# Altium project PGS-System.PrjPcb (part 12 of 16)

## Sheet ETH_SWITCH_INTERFACE.SchDoc
size 420 x 297 mm; SheetNumber: 20; SheetTotal: 27
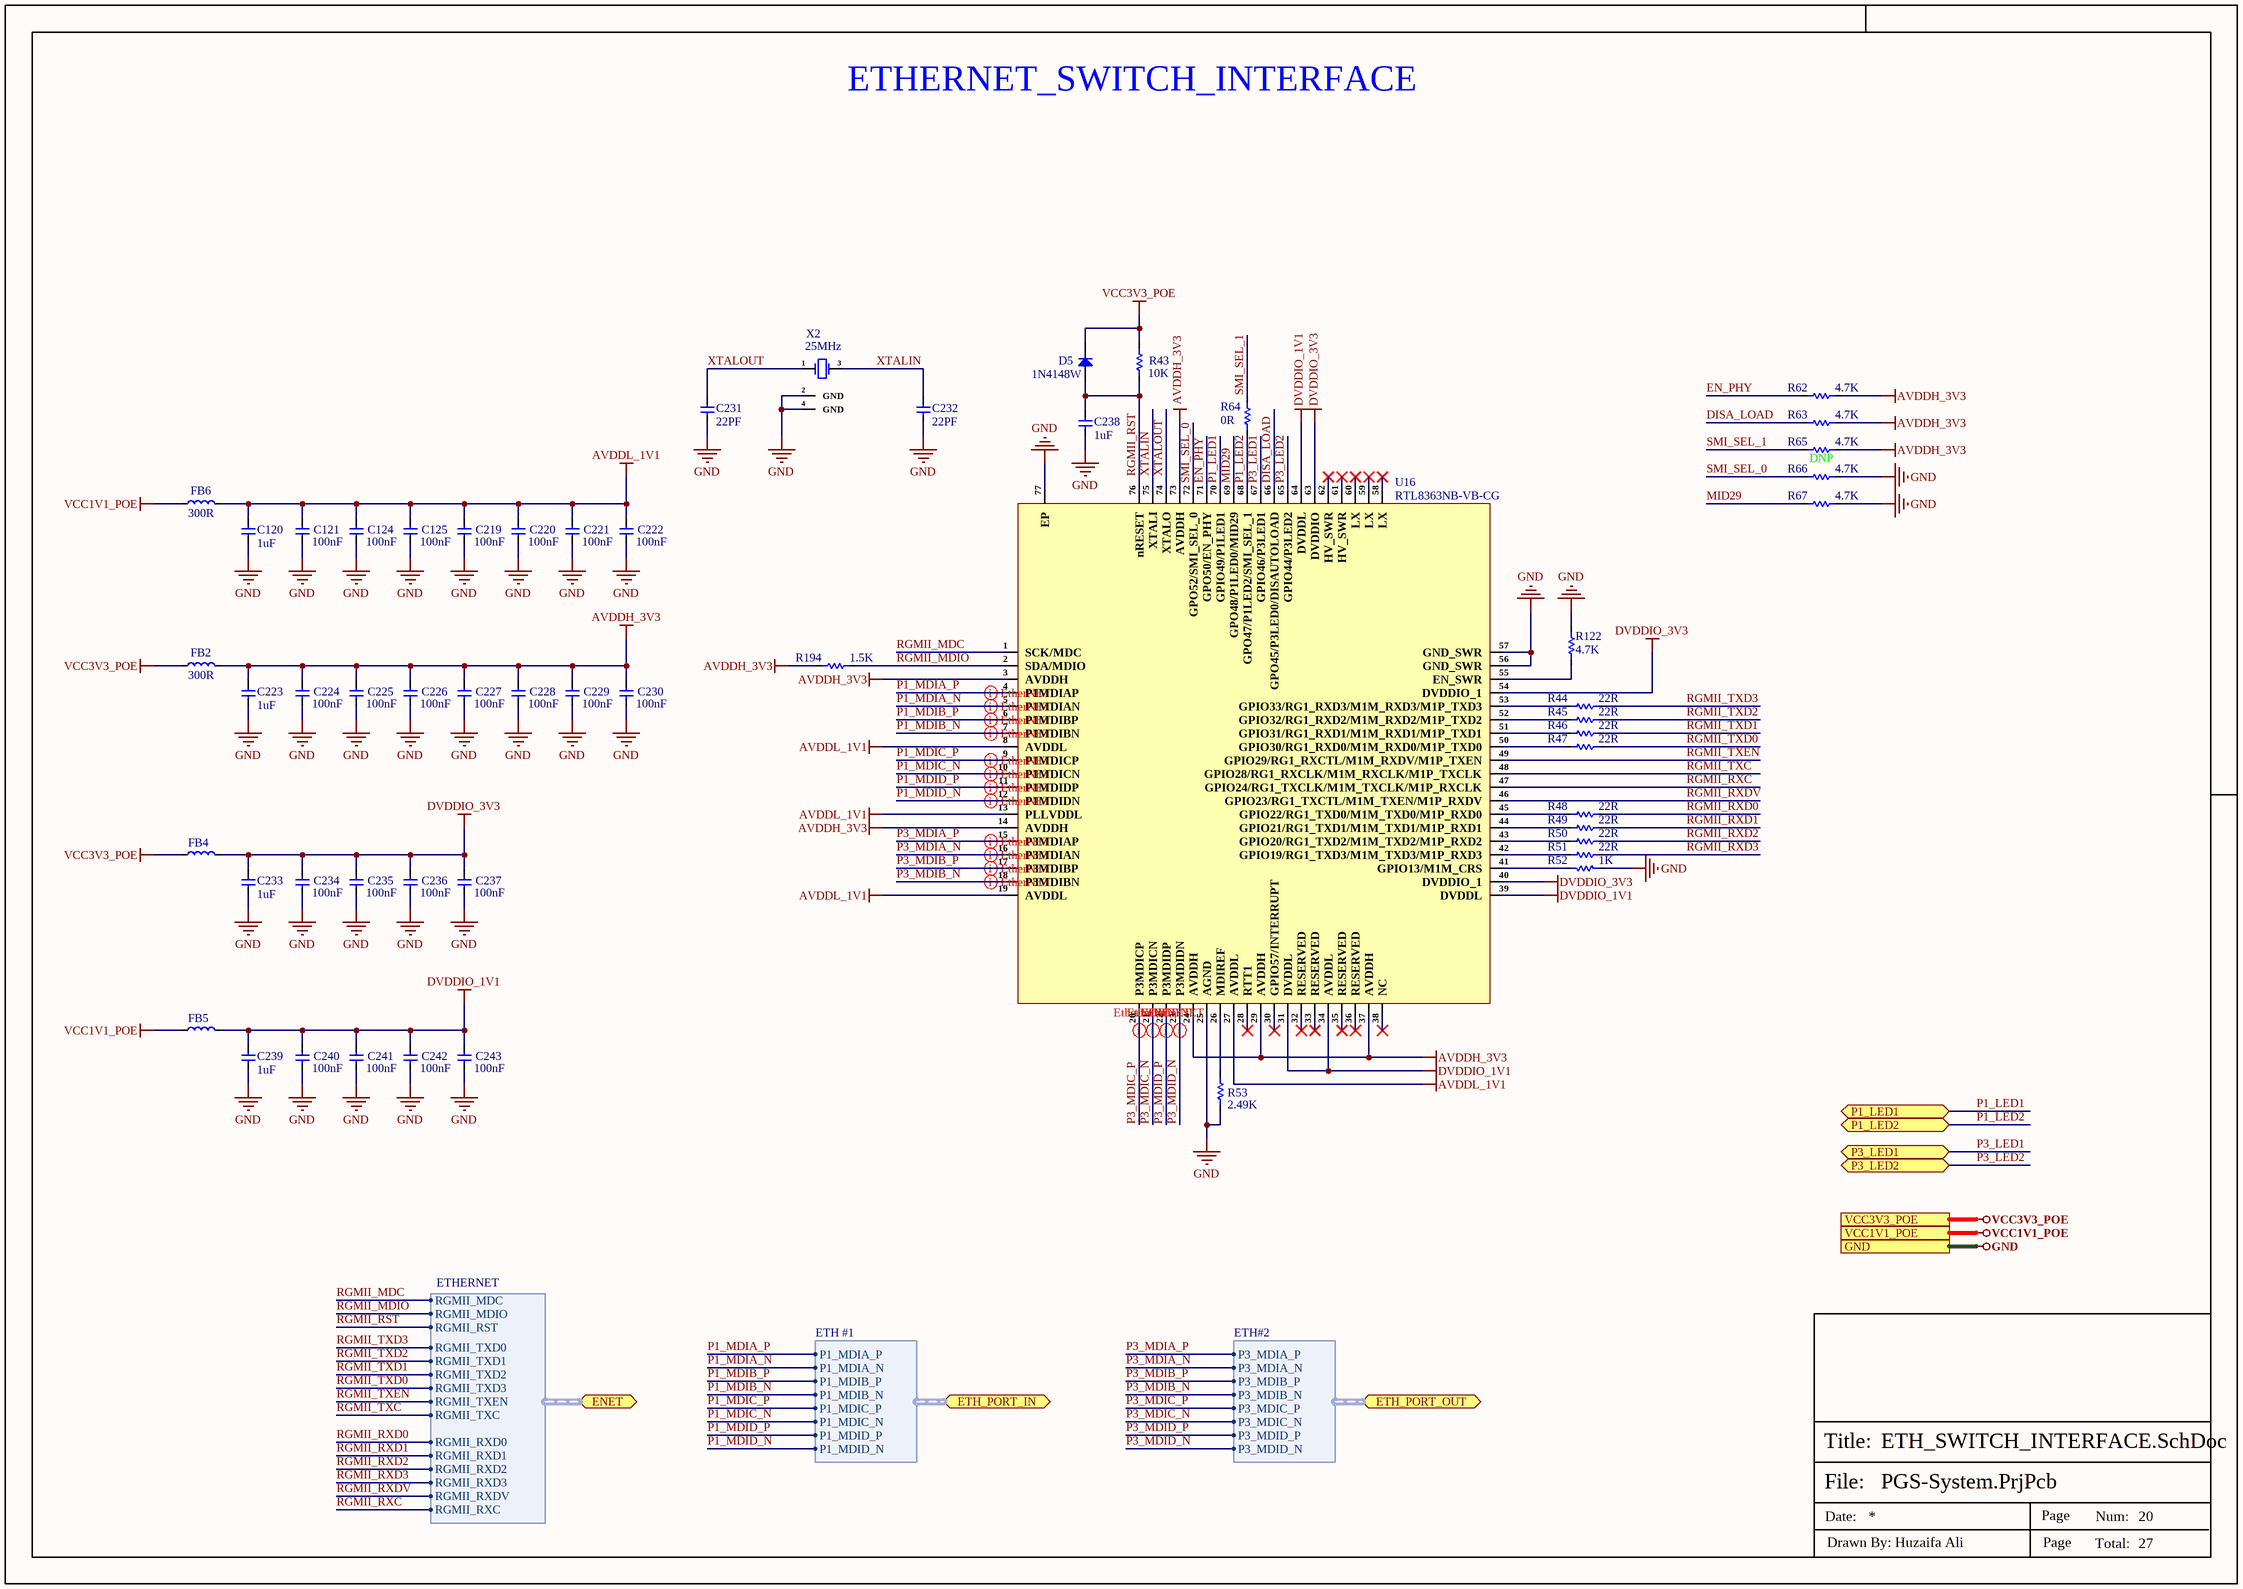
[diagram p20: ETH_SWITCH_INTERFACE.SchDoc]

### Parts
C120  1uF  [Cap-0402]
C121  100nF  [Cap-0402]
C124  100nF  [Cap-0402]
C125  100nF  [Cap-0402]
C219  100nF  [Cap-0402]
C220  100nF  [Cap-0402]
C221  100nF  [Cap-0402]
C222  100nF  [Cap-0402]
C223  1uF  [Cap-0402]
C224  100nF  [Cap-0402]
C225  100nF  [Cap-0402]
C226  100nF  [Cap-0402]
C227  100nF  [Cap-0402]
C228  100nF  [Cap-0402]
C229  100nF  [Cap-0402]
C230  100nF  [Cap-0402]
C231  22PF  [Cap-0402]
C232  22PF  [Cap-0402]
C233  1uF  [Cap-0402]
C234  100nF  [Cap-0402]
C235  100nF  [Cap-0402]
C236  100nF  [Cap-0402]
C237  100nF  [Cap-0402]
C238  1uF  [Cap-0402]
C239  1uF  [Cap-0402]
C240  100nF  [Cap-0402]
C241  100nF  [Cap-0402]
C242  100nF  [Cap-0402]
C243  100nF  [Cap-0402]
D5  1N4148W  [SOD-123]
FB2  300R  [IND-0603 (1608 Metric)]
FB4  742792641  [IND-0603 (1608 Metric)]  (value not drawn)
FB5  742792641  [IND-0603 (1608 Metric)]  (value not drawn)
FB6  300R  [IND-0603 (1608 Metric)]
R43  10K  [Res-0402]
R44  22R  [Res-0402]
R45  22R  [Res-0402]
R46  22R  [Res-0402]
R47  22R  [Res-0402]
R48  22R  [Res-0402]
R49  22R  [Res-0402]
R50  22R  [Res-0402]
R51  22R  [Res-0402]
R52  1K  [Res-0402]
R53  2.49K  [Res-0402]
R62  4.7K  [Res-0402]
R63  4.7K  [Res-0402]
R64  0R  [Res-0402]
R65  DNP  [Res-0402]
R66  4.7K  [Res-0402]
R67  4.7K  [Res-0402]
R122  4.7K  [Res-0402]
R194  1.5K  [Res-0402]
U16  RTL8363NB-VB-CG  [QFN-76]
X2  25MHz  [Q22FA12800090]

### Ports
ENET (bidir, harness ETHERNET, see RV1126_ETHERNET_SHEET[1D]), ETH_PORT_IN (bidir, harness ETH #1, see ETH_PoE-PD_INTERFACE[5D]), ETH_PORT_OUT (bidir, harness ETH#2, see PoE_PSE_CONTROLLER[4D]), GND (see BUCK_CONTROLLER_SHEET[3D], DDR3_SDRAM_SHEET[5D], DEBUG_UART_INTERFACE[3D], DIGITAL_MEMS_INTERFACE[3C], eMMC_INTERFACE[3D], ETH_PoE-PD_INTERFACE[4D], IR-CUT_LIGHT SENSOR_SHEET[3D], MIPI TO HDMI_MODULE[3D], MIPI-CSI_RXX_INTERFACE[3C], PoE_PSE_CONTROLLER[5D], POWER_LDO_SHEET[3D], POWER_PMIC_RK809_CODEC[3C], POWER_PMIC_RK809_DC DC[3D], POWER_PMIC_RK809_LDO[4C], POWER_PMIC_RK809_MGM[3D], RV1126_AUDIO_SHEET[3D], RV1126_DRAM_SHEET[4C], RV1126_eMMC_SPI-FLASH[3C], RV1126_ETHERNET_SHEET[3D], RV1126_OSC-PLL-PMUIO[3C], RV1126_POWER_SHEET[1D], RV1126_SARADC_SHEET[3C], RV1126_SDMMC_SHEET[3C], SPI_FLASH_INTERFACE[3D], USB2.0_DEBUG_UART[3D], WIFI_AP6256_SHEET[3C]), P1_LED1 (bidir, see ETH_PoE-PD_INTERFACE[3D]), P1_LED2 (bidir, see ETH_PoE-PD_INTERFACE[3D]), P3_LED1 (bidir, see PoE_PSE_CONTROLLER[5D]), P3_LED2 (bidir, see PoE_PSE_CONTROLLER[5D]), VCC1V1_POE (see POWER_LDO_SHEET[3D]), VCC3V3_POE (see PoE_PSE_CONTROLLER[5D], POWER_LDO_SHEET[3D])

### Harnesses
ETH #1: P1_MDIA_P, P1_MDIA_N, P1_MDIB_P, P1_MDIB_N, P1_MDIC_P, P1_MDIC_N, P1_MDID_P, P1_MDID_N
ETH#2: P3_MDIA_P, P3_MDIA_N, P3_MDIB_P, P3_MDIB_N, P3_MDIC_P, P3_MDIC_N, P3_MDID_P, P3_MDID_N
ETHERNET: RGMII_MDC, RGMII_MDIO, RGMII_RST, RGMII_TXD3, RGMII_TXD2, RGMII_TXD1, RGMII_TXD0, RGMII_TXEN, RGMII_TXC, RGMII_RXC, RGMII_RXDV, RGMII_RXD0, RGMII_RXD1, RGMII_RXD2, RGMII_RXD3

### Nets
AVDDH_3V3: C223.2 C224.2 C225.2 C226.2 C227.2 C228.2 C229.2 C230.2 FB2.2 R62.1 R63.1 R65.1 R194.1 U16.3(AVDDH) U16.14(AVDDH) U16.24(AVDDH) U16.29(AVDDH) U16.37(AVDDH) U16.73(AVDDH)
AVDDL_1V1: C120.2 C121.2 C124.2 C125.2 C219.2 C220.2 C221.2 C222.2 FB6.2 U16.8(AVDDL) U16.13(PLLVDDL) U16.19(AVDDL) U16.27(AVDDL)
DVDDIO_1V1: C239.2 C240.2 C241.2 C242.2 C243.2 FB5.2 U16.31(DVDDL) U16.34(AVDDL) U16.39(DVDDL) U16.64(DVDDL)
DVDDIO_3V3: C233.2 C234.2 C235.2 C236.2 C237.2 FB4.2 U16.40(DVDDIO_1) U16.54(DVDDIO_1) U16.63(DVDDIO)
GND: C120.1 C121.1 C124.1 C125.1 C219.1 C220.1 C221.1 C222.1 C223.1 C224.1 C225.1 C226.1 C227.1 C228.1 C229.1 C230.1 C231.1 C232.1 C233.1 C234.1 C235.1 C236.1 C237.1 C238.1 C239.1 C240.1 C241.1 C242.1 C243.1 R52.1 R53.1 R66.1 R67.1 R122.2 U16.25(AGND) U16.56(GND_SWR) U16.57(GND_SWR) U16.77(EP) X2.2(GND) X2.4(GND) ; port GND  [project net KSENSD]
VCC1V1_POE: FB5.1 FB6.1 ; port VCC1V1_POE
VCC3V3_POE: D5.2(K) FB2.1 FB4.1 R43.1 ; port VCC3V3_POE
DISA_LOAD: R63.2 U16.66(GPO45/P3LED0/DISAUTOLOAD)
EN_PHY: R62.2 U16.71(GPO50/EN_PHY)
MID29: R67.2 U16.69(GPO48/P1LED0/MID29)
P1_LED1: U16.70(GPIO49/P1LED1) ; port P1_LED1
P1_LED2: R64.1 U16.68(GPO47/P1LED2/SMI_SEL_1) ; port P1_LED2
P1_MDIA_N: U16.5(P1MDIAN) ; port ETH_PORT_IN.P1_MDIA_N
P1_MDIA_P: U16.4(P1MDIAP) ; port ETH_PORT_IN.P1_MDIA_P
P1_MDIB_N: U16.7(P1MDIBN) ; port ETH_PORT_IN.P1_MDIB_N
P1_MDIB_P: U16.6(P1MDIBP) ; port ETH_PORT_IN.P1_MDIB_P
P1_MDIC_N: U16.10(P1MDICN) ; port ETH_PORT_IN.P1_MDIC_N
P1_MDIC_P: U16.9(P1MDICP) ; port ETH_PORT_IN.P1_MDIC_P
P1_MDID_N: U16.12(P1MDIDN) ; port ETH_PORT_IN.P1_MDID_N
P1_MDID_P: U16.11(P1MDIDP) ; port ETH_PORT_IN.P1_MDID_P
P3_LED1: U16.67(GPIO46/P3LED1) ; port P3_LED1
P3_LED2: U16.65(GPIO44/P3LED2) ; port P3_LED2
P3_MDIA_N: U16.16(P3MDIAN) ; port ETH_PORT_OUT.P3_MDIA_N
P3_MDIA_P: U16.15(P3MDIAP) ; port ETH_PORT_OUT.P3_MDIA_P
P3_MDIB_N: U16.18(P3MDIBN) ; port ETH_PORT_OUT.P3_MDIB_N
P3_MDIB_P: U16.17(P3MDIBP) ; port ETH_PORT_OUT.P3_MDIB_P
P3_MDIC_N: U16.21(P3MDICN) ; port ETH_PORT_OUT.P3_MDIC_N
P3_MDIC_P: U16.20(P3MDICP) ; port ETH_PORT_OUT.P3_MDIC_P
P3_MDID_N: U16.23(P3MDIDN) ; port ETH_PORT_OUT.P3_MDID_N
P3_MDID_P: U16.22(P3MDIDP) ; port ETH_PORT_OUT.P3_MDID_P
RGMII_MDC: U16.1(SCK/MDC) ; port ENET.RGMII_MDC
RGMII_MDIO: R194.2 U16.2(SDA/MDIO) ; port ENET.RGMII_MDIO
RGMII_RST: C238.2 D5.1(A) R43.2 U16.76(nRESET) ; port ENET.RGMII_RST
RGMII_RXC: U16.47(GPIO24/RG1_TXCLK/M1M_TXCLK/M1P_RXCLK) ; port ENET.RGMII_RXC
RGMII_RXD0: R48.2 ; port ENET.RGMII_RXD0
RGMII_RXD1: R49.2 ; port ENET.RGMII_RXD1
RGMII_RXD2: R50.2 ; port ENET.RGMII_RXD2
RGMII_RXD3: R51.2 ; port ENET.RGMII_RXD3
RGMII_RXDV: U16.46(GPIO23/RG1_TXCTL/M1M_TXEN/M1P_RXDV) ; port ENET.RGMII_RXDV
RGMII_TXC: U16.48(GPIO28/RG1_RXCLK/M1M_RXCLK/M1P_TXCLK) ; port ENET.RGMII_TXC
RGMII_TXD0: R47.2 ; port ENET.RGMII_TXD3
RGMII_TXD1: R46.2 ; port ENET.RGMII_TXD2
RGMII_TXD2: R45.2 ; port ENET.RGMII_TXD1
RGMII_TXD3: R44.2 ; port ENET.RGMII_TXD0
RGMII_TXEN: U16.49(GPIO29/RG1_RXCTL/M1M_RXDV/M1P_TXEN) ; port ENET.RGMII_TXEN
SMI_SEL_0: R66.2 U16.72(GPO52/SMI_SEL_0)
SMI_SEL_1: R64.2 R65.2
XTALIN: C232.2 U16.75(XTALI) X2.3(OSC2)
XTALOUT: C231.2 U16.74(XTALO) X2.1(OSC1)
NetR44_1: R44.1 U16.53(GPIO33/RG1_RXD3/M1M_RXD3/M1P_TXD3)
NetR45_1: R45.1 U16.52(GPIO32/RG1_RXD2/M1M_RXD2/M1P_TXD2)
NetR46_1: R46.1 U16.51(GPIO31/RG1_RXD1/M1M_RXD1/M1P_TXD1)
NetR47_1: R47.1 U16.50(GPIO30/RG1_RXD0/M1M_RXD0/M1P_TXD0)
NetR48_1: R48.1 U16.45(GPIO22/RG1_TXD0/M1M_TXD0/M1P_RXD0)
NetR49_1: R49.1 U16.44(GPIO21/RG1_TXD1/M1M_TXD1/M1P_RXD1)
NetR50_1: R50.1 U16.43(GPIO20/RG1_TXD2/M1M_TXD2/M1P_RXD2)
NetR51_1: R51.1 U16.42(GPIO19/RG1_TXD3/M1M_TXD3/M1P_RXD3)
NetR52_2: R52.2 U16.41(GPIO13/M1M_CRS)
NetR53_2: R53.2 U16.26(MDIREF)
NetR122_1: R122.1 U16.55(EN_SWR)

Not connected (* = marked no-connect by the designer): U16 28(RTT1)* 30(GPIO57/INTERRUPT)* 32(RESERVED)* 33(RESERVED)* 35(RESERVED)* 36(RESERVED)* 38(NC)* 58(LX)* 59(LX)* 60(LX)* 61(HV_SWR)* 62(HV_SWR)*

### Layout directives
differential pair; differential pair class Ethernet_Lines; net class Ethernet; rule Matched Net Lengths [Tolerance = 20mil]; rule Impedance Constraint [Min = 97.00    Max = 105.0    ]: P1_MDIA_N, P1_MDIA_P, P1_MDIB_N, P1_MDIB_P, P1_MDIC_N, P1_MDIC_P, P1_MDID_N, P1_MDID_P, P3_MDIA_N, P3_MDIA_P, P3_MDIB_N, P3_MDIB_P, P3_MDIC_N, P3_MDIC_P, P3_MDID_N, P3_MDID_P

### Notes on the sheet
- ETHERNET_SWITCH_INTERFACE
- (near R43) AVDDH_3V3
- (near R64) DVDDIO_1V1
- DVDDIO_3V3
- (near R65) 4.7K
- File:
- Title:
- Date:
- Page
- Num:
- Total:
- Drawn By: Huzaifa Ali

### Library data of the parts
C120 C223 C233 C238 C239 = CC0402KRX5R7BB105: CAP CER 1UF 16V X5R 0402; Manufacturer: Yageo; Tolerance: 10%; Item Type: Capacitor; Supplier 1: Digi-Key; Manufacturer Part Number: CC0402KRX5R7BB105; Stock 1: 1405667; Pricing 1: 1=0.36, 10=0.252, 100=0.1512, 500=0.1134, 1000=0.09576, 2500=0.09072, 5000=0.08568 (USD); Mount: Surface Mount; Case/Package: 0402; Weight: 2.3E-05oz; Case Code (Imperial): 0402; Case Code (Metric): 1005; Min Operating Temperature: -55°C; Max Operating Temperature: 85°C; Capacitance: 1uF; Dielectric: X5R; Packaging: Tape and Reel; Voltage Rating (DC): 16V; Voltage Rating: 16V; Termination: SMD/SMT; Composition: Ceramic; Length: 1mm; Height: 0.5mm; Width: 0.02inch; Thickness: 0.022inch; Depth: 0.5mm; Radiation Hardening: No; Lead Free: Lead Free; Halogen Free: Halogen Free; ComponentLink1URL: http://www.yageo.com/documents/recent/UPY-GPHC_X5R_4V-to-50V_12.pdf?src-supplier=Avnet+Europe; ComponentLink1Description: http://www.yageo.com/documents/recent/UPY-GPHC_X5R_4V-to-50V_12.pdf?src-supplier=Avnet+Europe; Supplier Part Number 1: 311-1691-6-ND; LCSC Part Number: C325464
C121 C124 C125 C219-C222 C224-C230 C234-C237 C240-C243 = CC0402KRX5R7BB104: CAP CER 0.1UF 16V X5R 0402; Manufacturer: Yageo; Tolerance: 10%; Supplier 1: Mouser; Manufacturer Part Number: CC0402KRX5R7BB104; RoHS: Yes; Category: Ceramic Capacitors; Stock 1: 936792; Pricing 1: 1=0.10000, 10=0.02300, 50=0.02300, 100=0.01100, 1000=0.00600, 10000=0.00400 (USD); Mount: Surface Mount; Case/Package: 0402; Case Code (Imperial): 0402; Case Code (Metric): 1005; Min Operating Temperature: -55°C; Max Operating Temperature: 85°C; Capacitance: 100nF; Packaging: Tape and Reel; Voltage Rating: 16V; Dielectric: X5R; Termination: SMD/SMT; Voltage Rating (DC): 16V; Package Quantity: 1; Length: 1mm; Width: 0.02inch; Thickness: 0.022inch; Lead Free: Lead Free; Halogen Free: Halogen Free; ComponentLink1URL: https://datasheet.ciiva.com/155/mlccorderingcode-155879.pdf?src-supplier=Digi-Key; ComponentLink1Description: https://datasheet.ciiva.com/155/mlccorderingcode-155879.pdf?src-supplier=Digi-Key; ComponentLink2URL: https://datasheet.ciiva.com/155/mlccorderingcode-155878.pdf?src-supplier=Digi-Key; ComponentLink2Description: https://datasheet.ciiva.com/155/mlccorderingcode-155878.pdf?src-supplier=Digi-Key; ComponentLink3URL: https://datasheet.ciiva.com/155/mlccorderingcode-155880.pdf?src-supplier=Digi-Key; ComponentLink3Description: https://datasheet.ciiva.com/155/mlccorderingcode-155880.pdf?src-supplier=Digi-Key; Supplier Part Number 1: 603-CC402KRX5R7BB104; LCSC Part Number: C106204; Number of Pins: 2; Resistor Type: Ceramic; Series: CC; Construction: Flat; Height: 0.5mm; Depth: 0.5mm; Radiation Hardening: No; REACH SVHC: Unknown; RoHS Compliant: Yes; ComponentLink4URL: https://datasheet.ciiva.com/11464/upy-gphc-x5r-4v-to-50v-12-11464869.pdf?src-supplier=Avnet; ComponentLink4Description: https://datasheet.ciiva.com/11464/upy-gphc-x5r-4v-to-50v-12-11464869.pdf?src-supplier=Avnet
C231 C232 = CC0402JRNPO9BN220: CAP CER 22PF 50V C0G/NPO 0402; Manufacturer: Yageo; Dielectric Material: Ceramic; Tolerance: 5%; Dielectric: C0G; Temperature Coefficient: 30ppm/°C; Insulation Resistance: 100GR; Item Type: Capacitor; Supplier 1: Future Electronics; Manufacturer Part Number: CC0402JRNPO9BN220; RoHS: Yes; Category: Ceramic Capacitors; Stock 1: 200000; Pricing 1: 10000=0.00220, 40000=0.00210, 150000=0.00200, 400000=0.00190, 1000000=0.00180 (USD); Mounting Technology: Surface Mount; Case/Package: 0402; Pins: 2; Case Code (Metric): 1005; Case Code (Imperial): 0402; Min Operating Temperature: -55°C; Max Operating Temperature: 125°C; Value: 22pF; Voltage Rating: 50V; Packaging: Tape and Reel; Package Quantity: 1; Voltage Rating (DC): 50V; Termination: SMD/SMT; Resistor Type: Ceramic; Voltage: 50V; Series: CC; Length: 1mm; Width: 0.02inch; Height: 0.5mm; Thickness: 0.022inch; Depth: 0.5mm; Radiation Hardening: No; Reach SVHC Compliant: Yes; Lead Free: Lead Free; RoHS Compliant: Yes; ComponentLink1URL: https://datasheet.ciiva.com/5789/1443161-5789509.pdf?src-supplier=Farnell; ComponentLink1Description: https://datasheet.ciiva.com/5789/1443161-5789509.pdf?src-supplier=Farnell; ComponentLink2URL: https://datasheet.ciiva.com/8033/1443161-8033606.pdf?src-supplier=Element14; ComponentLink2Description: https://datasheet.ciiva.com/8033/1443161-8033606.pdf?src-supplier=Element14; ComponentLink3URL: https://datasheet.ciiva.com/7656/1132289-7656615.pdf?src-supplier=Element14; ComponentLink3Description: https://datasheet.ciiva.com/7656/1132289-7656615.pdf?src-supplier=Element14; ComponentLink4URL: https://datasheet.ciiva.com/8033/1443161-8033607.pdf?src-supplier=Element14; ComponentLink4Description: https://datasheet.ciiva.com/8033/1443161-8033607.pdf?src-supplier=Element14; ComponentLink5URL: https://datasheet.ciiva.com/8033/1443161-8033605.pdf?src-supplier=Element14; ComponentLink5Description: https://datasheet.ciiva.com/8033/1443161-8033605.pdf?src-supplier=Element14; ComponentLink6URL: https://datasheet.ciiva.com/143/mlccorderingcode-143987.pdf?src-supplier=Digi-Key; ComponentLink6Description: https://datasheet.ciiva.com/143/mlccorderingcode-143987.pdf?src-supplier=Digi-Key; ComponentLink7URL: https://datasheet.ciiva.com/143/mlccorderingcode-143986.pdf?src-supplier=Digi-Key; ComponentLink7Description: https://datasheet.ciiva.com/143/mlccorderingcode-143986.pdf?src-supplier=Digi-Key; ComponentLink8URL: https://datasheet.ciiva.com/143/mlccorderingcode-143988.pdf?src-supplier=Digi-Key; ComponentLink8Description: https://datasheet.ciiva.com/143/mlccorderingcode-143988.pdf?src-supplier=Digi-Key; ComponentLink9URL: https://datasheet.ciiva.com/5425/upy-gp-np0-16v-to-50v-8-5425483.pdf?src-supplier=Mouser; ComponentLink9Description: https://datasheet.ciiva.com/5425/upy-gp-np0-16v-to-50v-8-5425483.pdf?src-supplier=Mouser; ComponentLink10URL: https://datasheet.ciiva.com/15189/getdatasheetpartid-370074-15189117.pdf?src-supplier=Verical; ComponentLink10Description: https://datasheet.ciiva.com/15189/getdatasheetpartid-370074-15189117.pdf?src-supplier=Verical; Supplier Part Number 1: 9105957; LCSC Part Number: C106203
D5 = 1N4148W: 100V 400mW Single 1.25V@150mA 8ns 300mA SOD-123 Switching Diode ROHS; Manufacturer: JSMSEMI; ComponentLink1Description: LCSC; ComponentLink1URL: https://www.lcsc.com/product-detail/Switching-Diode_JSMSEMI-1N4148W_C917030.html; Manufacturer Part Number: 1N4148W; Package: SOD-123; LCSC Part Number: C917030; Item Type: Diode
FB2 FB6 = ACMS160808A3012A: 150mΩ ±25% 300Ω@100MHz 0603 Ferrite Beads ROHS; Manufacturer: HYHONGYEX; Manufacturer Part Number: ACMS160808A3012A; Package: 0603; LCSC Part Number: C963867; Item Type: Ferrite Bead; ComponentLink1Description: LCSC; ComponentLink1URL: https://www.lcsc.com/product-detail/span-style-background-color-ff0-Ferrite-span-Beads_HYHONGYEX-ACMS160808A3012A_C963867.html
FB4 FB5 = 742792641: FERRITE BEAD 300 OHM 0603 1LN; Manufacturer: Wurth Electronics; RMS Current (Irms): 2A; ESR: 150mR; Tolerance: 25%; Impedance: 300R; Number of Lines: 1; Test Frequency: 100MHz; Value: 18nH; Supplier: Digikey; LCSC Part Number: C2649308; Manufacturer Part Number: 742792641; RoHS: Yes; Item Type: Ferrite Bead; Stock: 95770; Pricing: 1=0.18, 50=0.179, 100=0.165, 500=0.158, 1000=0.15, 2000=0.143 (USD); Mounting Technology: Surface Mount; Case/Package: SMD/SMT; Weight: 0.000141oz; Core Material: Ferrite; Case Code (Metric): 1608; Case Code (Imperial): 0603; Material: Ferrite; Min Operating Temperature: -55°C; Max Operating Temperature: 125°C; Package Quantity: 1; Current Rating: 2A; Packaging: Tape and Reel; Max Current Rating: 2A; Max DC Current: 2A; Termination: SMD/SMT; Series: WE-CBF; Length: 1.6mm; Width: 0.8mm; Height: 0.8mm; Depth: 0.8mm; Lead Free: Lead Free; Reach SVHC Compliant: Unknown; RoHS Compliant: Yes; ComponentLink1URL: https://datasheet.ciiva.com/1466/1705830-1466501.pdf?src-supplier=Element14; ComponentLink1Description: https://datasheet.ciiva.com/1466/1705830-1466501.pdf?src-supplier=Element14; ComponentLink2URL: https://datasheet.ciiva.com/11800/0900766b80d2e072-11800409.pdf?src-supplier=Rs; ComponentLink2Description: https://datasheet.ciiva.com/11800/0900766b80d2e072-11800409.pdf?src-supplier=Rs; ComponentLink3URL: https://datasheet.ciiva.com/4940/742792641-72209-4940450.pdf?src-supplier=Mouser; ComponentLink3Description: https://datasheet.ciiva.com/4940/742792641-72209-4940450.pdf?src-supplier=Mouser; ComponentLink4URL: https://datasheet.ciiva.com/1013/742792641-1013888.pdf?src-supplier=Digikey; ComponentLink4Description: https://datasheet.ciiva.com/1013/742792641-1013888.pdf?src-supplier=Digikey; ComponentLink5URL: https://datasheet.ciiva.com/1466/1705830-1466502.pdf?src-supplier=Element14; ComponentLink5Description: https://datasheet.ciiva.com/1466/1705830-1466502.pdf?src-supplier=Element14; ComponentLink6URL: https://datasheet.ciiva.com/1013/742792641-1013889.pdf?src-supplier=Digikey; ComponentLink6Description: https://datasheet.ciiva.com/1013/742792641-1013889.pdf?src-supplier=Digikey
R43 = RC0402FR-0710KL: RES 10K OHM 1% 1/16W 0402; Manufacturer: Yageo; Max Power Dissipation: 63mW; Temperature Coefficient: 100ppm/°C; Resistance: 10kR; Voltage Rating (DC): 50V; Power Rating: 62.5mW; Item Type: Resistor; Manufacturer Part Number: RC0402FR-0710KL; RoHS: Yes; Category: Chip SMD Resistors; Case/Package: 0402; Case Code (Imperial): 0402; Case Code (Metric): 1005; Min Operating Temperature: -55°C; Max Operating Temperature: 155°C; Features: Moisture Resistant; Packaging: Tape and Reel; Tolerance: 1%; Number of Terminations: 2; Series: RC; RoHS Compliant: Yes; ComponentLink1URL: https://datasheet.ciiva.com/7660/38568-7660787.pdf?src-supplier=Element14; ComponentLink1Description: https://datasheet.ciiva.com/7660/38568-7660787.pdf?src-supplier=Element14; Supplier 1: Mouser; Stock 1: 18648329; Pricing 1: 1=0.10000, 10=0.01400, 50=0.01400, 100=0.00500, 1000=0.00300, 10000=0.00200 (USD); Number of Pins: 2; Resistor Type: Thick Film; Voltage Rating: 50V; Termination: SMD/SMT; Resistance Tolerance: 1%; Construction: Rectangular; Length: 1mm; Width: 0.5mm; Height: 0.32mm; Depth: 0.5mm; Lead Pitch: 0.2mm; REACH SVHC: No SVHC; Lead Free: Lead Free; Military Standard: Not; ComponentLink2URL: https://datasheet.ciiva.com/7849/1686128-7849814.pdf?src-supplier=Element14; ComponentLink2Description: https://datasheet.ciiva.com/7849/1686128-7849814.pdf?src-supplier=Element14; ComponentLink3URL: https://datasheet.ciiva.com/7983/1018594-7983486.pdf?src-supplier=Element14; ComponentLink3Description: https://datasheet.ciiva.com/7983/1018594-7983486.pdf?src-supplier=Element14; ComponentLink4URL: https://datasheet.ciiva.com/22747/1018594-22747512.pdf?src-supplier=Element14; ComponentLink4Description: https://datasheet.ciiva.com/22747/1018594-22747512.pdf?src-supplier=Element14; ComponentLink5URL: https://datasheet.ciiva.com/12667/pyu-rc0402-51-rohs-l-6-r-12667067.pdf?src-supplier=Mouser; ComponentLink5Description: https://datasheet.ciiva.com/12667/pyu-rc0402-51-rohs-l-6-r-12667067.pdf?src-supplier=Mouser; ComponentLink6URL: https://datasheet.ciiva.com/7849/1784430-7849813.pdf?src-supplier=Element14; ComponentLink6Description: https://datasheet.ciiva.com/7849/1784430-7849813.pdf?src-supplier=Element14; Supplier Part Number 1: 603-RC0402FR-0710KL; LCSC Part Number: C60490; Working Voltage: 50V; ComponentLink7URL: https://datasheet.ciiva.com/7849/1784430-7849815.pdf?src-supplier=Element14; ComponentLink7Description: https://datasheet.ciiva.com/7849/1784430-7849815.pdf?src-supplier=Element14
R44-R51 = RC0402FR-0722RL: RES 22 OHM 1% 1/16W 0402; Manufacturer: Yageo; Voltage Rating: 50V; Power Rating: 62.5mW; Temperature Coefficient: 100ppm/°C; Max Power Dissipation: 63mW; Item Type: Resistor; Supplier 1: Avnet; Manufacturer Part Number: RC0402FR-0722RL; RoHS: Yes; Category: Chip SMD Resistors; Stock 1: 1810000; Pricing 1: 10000=0.00085 (USD); Case/Package: 0402; Number of Pins: 2; Case Code (Imperial): 0402; Case Code (Metric): 1005; Size Code: 0402; Min Operating Temperature: -55°C; Max Operating Temperature: 155°C; Resistor Type: Thick Film; Voltage Rating (DC): 50V; Resistance: 22R; Tolerance: 1%; Packaging: Tape and Reel; Termination: SMD/SMT; Features: Moisture Resistant; Series: RC; Number of Terminations: 2; Resistance Tolerance: 1%; Technology: THICK FILM; Construction: Rectangular; Length: 1mm; Width: 0.5mm; Height: 0.32mm; Depth: 0.5mm; RoHS Compliant: Yes; Reach SVHC Compliant: Yes; Military Standard: Not; Lead Free: Lead Free; ComponentLink1URL: https://datasheet.ciiva.com/11819/0900766b80c66297-11819462.pdf?src-supplier=RSComponents; ComponentLink1Description: https://datasheet.ciiva.com/11819/0900766b80c66297-11819462.pdf?src-supplier=RSComponents; ComponentLink2URL: https://datasheet.ciiva.com/7849/1018594-7849912.pdf?src-supplier=Element14; ComponentLink2Description: https://datasheet.ciiva.com/7849/1018594-7849912.pdf?src-supplier=Element14; ComponentLink3URL: https://datasheet.ciiva.com/7849/1018594-7849911.pdf?src-supplier=Element14; ComponentLink3Description: https://datasheet.ciiva.com/7849/1018594-7849911.pdf?src-supplier=Element14; ComponentLink4URL: https://datasheet.ciiva.com/16930/pyu-rc0402-51-rohs-l-6-r-16930687.pdf?src-supplier=Future+Electronics; ComponentLink4Description: https://datasheet.ciiva.com/16930/pyu-rc0402-51-rohs-l-6-r-16930687.pdf?src-supplier=Future+Electronics; ComponentLink5URL: https://datasheet.ciiva.com/26829/getdatasheetpartid-554995-26829991.pdf?src-supplier=Verical; ComponentLink5Description: https://datasheet.ciiva.com/26829/getdatasheetpartid-554995-26829991.pdf?src-supplier=Verical; Supplier Part Number 1: RC0402FR-0722RL; LCSC Part Number: C114765
R52 = RC0402FR-071KL: RES 1K OHM 1% 1/16W 0402; Manufacturer: Yageo; Resistance: 1kR; Temperature Coefficient: 100ppm/°C; Voltage Rating (DC): 50V; Power Rating: 62.5mW; Max Power Dissipation: 63mW; Item Type: Resistor; Supplier 1: Avnet; Manufacturer Part Number: RC0402FR-071KL; RoHS: Yes; Category: Chip SMD Resistors; Stock 1: 13030000; Pricing 1: 10000=0.00085, 20000=0.00087, 40000=0.00084, 60000=0.00083, 80000=0.00079, 100000=0.00078, 1000000=0.00076 (USD); Case/Package: 0402; Number of Pins: 2; Case Code (Imperial): 0402; Case Code (Metric): 1005; Size Code: 0402; Min Operating Temperature: -55°C; Max Operating Temperature: 155°C; Resistor Type: Thick Film; Tolerance: 1%; Packaging: Tape and Reel; Voltage Rating: 50V; Termination: SMD/SMT; Features: Moisture Resistant; Series: RC; Number of Terminations: 2; Resistance Tolerance: 1%; Construction: Rectangular; Technology: THICK FILM; Length: 1mm; Width: 0.5mm; Height: 0.32mm; Depth: 0.5mm; Reach SVHC Compliant: Yes; Lead Free: Lead Free; RoHS Compliant: Yes; Military Standard: Not; ComponentLink1URL: https://datasheet.ciiva.com/11819/0900766b80c66297-11819477.pdf?src-supplier=RSComponents; ComponentLink1Description: https://datasheet.ciiva.com/11819/0900766b80c66297-11819477.pdf?src-supplier=RSComponents; ComponentLink2URL: https://datasheet.ciiva.com/7983/1018594-7983502.pdf?src-supplier=Element14; ComponentLink2Description: https://datasheet.ciiva.com/7983/1018594-7983502.pdf?src-supplier=Element14; ComponentLink3URL: https://datasheet.ciiva.com/22747/1018594-22747513.pdf?src-supplier=Element14; ComponentLink3Description: https://datasheet.ciiva.com/22747/1018594-22747513.pdf?src-supplier=Element14; ComponentLink4URL: https://datasheet.ciiva.com/12666/pyu-rc0402-51-rohs-l-6-r-12666741.pdf?src-supplier=Mouser; ComponentLink4Description: https://datasheet.ciiva.com/12666/pyu-rc0402-51-rohs-l-6-r-12666741.pdf?src-supplier=Mouser; ComponentLink5URL: https://datasheet.ciiva.com/7849/1018594-7849869.pdf?src-supplier=Element14; ComponentLink5Description: https://datasheet.ciiva.com/7849/1018594-7849869.pdf?src-supplier=Element14; ComponentLink6URL: https://datasheet.ciiva.com/7849/1018594-7849871.pdf?src-supplier=Element14; ComponentLink6Description: https://datasheet.ciiva.com/7849/1018594-7849871.pdf?src-supplier=Element14; ComponentLink7URL: https://datasheet.ciiva.com/17063/pyu-rc0402-51-rohs-l-6-r-17063193.pdf?src-supplier=Future+Electronics; ComponentLink7Description: https://datasheet.ciiva.com/17063/pyu-rc0402-51-rohs-l-6-r-17063193.pdf?src-supplier=Future+Electronics; Supplier Part Number 1: RC0402FR-071KL; LCSC Part Number: C106235
R53 = RC0402FR-072K49L: RES 2.49K OHM 1% 1/16W 0402; Manufacturer: Yageo; Item Type: Resistors; Value: 2.49kR; Temperature Coefficient: 100ppm/°C; Power Rating: 62.5mW; Voltage Rating: 50V; Max Power Dissipation: 63mW; Supplier: Future Electronics; Supplier Part Number: 7635139; Manufacturer Part Number: RC0402FR-072K49L; RoHS: Yes; Stock: 530000; Pricing: 10000=0.0012, 100000=0.0011, 300000=0.001, 750000=0.001, 2000000=0.0009 (USD); Case/Package: 0402; Case Code (Metric): 1005; Case Code (Imperial): 0402; Contact Plating: Tin,Lead; Min Operating Temperature: -55°C; Max Operating Temperature: 155°C; Tolerance: 1%; Resistor Type: Thick Film; Package Quantity: 1; Packaging: Tape and Reel; Number of Terminations: 2; Termination: SMD/SMT; Voltage Rating (DC): 50V; Features: Moisture Resistant; Series: RC; Resistance Tolerance: 1%; Length: 0.039inch; Width: 0.02inch; Height: 0.016inch; Reach SVHC Compliant: No; Lead Free: Lead Free; RoHS Compliant: Yes; ComponentLink1URL: https://datasheet.ciiva.com/2518/pyu-r-int-thick-7-2518986.pdf?src-supplier=Digikey; ComponentLink1Description: https://datasheet.ciiva.com/2518/pyu-r-int-thick-7-2518986.pdf?src-supplier=Digikey; ComponentLink2URL: https://datasheet.ciiva.com/2518/pyu-r-int-thick-7-2518987.pdf?src-supplier=Digikey; ComponentLink2Description: https://datasheet.ciiva.com/2518/pyu-r-int-thick-7-2518987.pdf?src-supplier=Digikey; ComponentLink3URL: https://datasheet.ciiva.com/7983/1018594-7983516.pdf?src-supplier=Element14; ComponentLink3Description: https://datasheet.ciiva.com/7983/1018594-7983516.pdf?src-supplier=Element14; ComponentLink4URL: https://datasheet.ciiva.com/2518/pyu-r-int-thick-7-2518985.pdf?src-supplier=Digikey; ComponentLink4Description: https://datasheet.ciiva.com/2518/pyu-r-int-thick-7-2518985.pdf?src-supplier=Digikey; ComponentLink5URL: https://datasheet.ciiva.com/5558/pyu-rc0402-51-rohs-l-6-r-5558122.pdf?src-supplier=Mouser; ComponentLink5Description: https://datasheet.ciiva.com/5558/pyu-rc0402-51-rohs-l-6-r-5558122.pdf?src-supplier=Mouser; LCSC Part Number: C145071
R62 R63 R65-R67 R122 = RC0402FR-074K7L: RES 4.7K OHM 1% 1/16W 0402; Manufacturer: Yageo; Voltage Rating (DC): 50V; Power Rating: 62.5mW; Resistance: 4.7kR; Temperature Coefficient: 100ppm/°C; Max Power Dissipation: 63mW; Item Type: Resistor; Supplier 1: Avnet; Manufacturer Part Number: RC0402FR-074K7L; RoHS: Yes; Category: Chip SMD Resistors; Stock 1: 2420000; Pricing 1: 10000=0.00085 (USD); Case/Package: 0402; Number of Pins: 2; Case Code (Imperial): 0402; Case Code (Metric): 1005; Size Code: 0402; Min Operating Temperature: -55°C; Max Operating Temperature: 155°C; Tolerance: 1%; Voltage Rating: 50V; Packaging: Tape and Reel; Resistor Type: Thick Film; Termination: SMD/SMT; Features: Moisture Resistant; Series: RC; Number of Terminations: 2; Resistance Tolerance: 1%; Construction: Rectangular; Length: 1mm; Width: 0.5mm; Height: 0.32mm; Depth: 0.5mm; Height - Seated (Max): 0.016inch; RoHS Compliant: Yes; Reach SVHC Compliant: Yes; Military Standard: Not; Lead Free: Lead Free; ComponentLink1URL: https://datasheet.ciiva.com/22661/1686128-22661342.pdf?src-supplier=Element14; ComponentLink1Description: https://datasheet.ciiva.com/22661/1686128-22661342.pdf?src-supplier=Element14; ComponentLink2URL: https://datasheet.ciiva.com/7850/1018594-7850022.pdf?src-supplier=Element14; ComponentLink2Description: https://datasheet.ciiva.com/7850/1018594-7850022.pdf?src-supplier=Element14; ComponentLink3URL: https://datasheet.ciiva.com/7850/1018594-7850023.pdf?src-supplier=Element14; ComponentLink3Description: https://datasheet.ciiva.com/7850/1018594-7850023.pdf?src-supplier=Element14; ComponentLink4URL: https://datasheet.ciiva.com/15215/getdatasheetpartid-328119-15215035.pdf?src-supplier=Verical; ComponentLink4Description: https://datasheet.ciiva.com/15215/getdatasheetpartid-328119-15215035.pdf?src-supplier=Verical; Supplier Part Number 1: RC0402FR-074K7L; LCSC Part Number: C105871
R64 = RC0402FR-070RL: as R28 on sheet DDR3_SDRAM_SHEET; Supplier 1: Mouser; Manufacturer Part Number: RC0402FR-070RL; RoHS: Yes; Stock 1: 8556842; Pricing 1: 1=0.10000, 10=0.01400, 50=0.01400, 100=0.00600, 1000=0.00300, 5000=0.00200, 10000=0.00100 (USD); Mount: Surface Mount; Case/Package: 0402; Contact Plating: Tin,Matte; Case Code (Imperial): 0402; Case Code (Metric): 1005; Size Code: 0402; Min Operating Temperature: -55°C; Max Operating Temperature: 155°C; Resistance: 0R; Resistor Type: Thick Film; Packaging: Tape and Reel; Termination: SMD/SMT; Features: Moisture Resistant; Series: RC; Number of Terminations: 2; Length: 1mm; Width: 0.5mm; Height: 0.35mm; Radiation Hardening: No; Lead Free: Lead Free; RoHS Compliant: Yes; ComponentLink1URL: https://datasheet.ciiva.com/8896/pyu-rc0402-51-rohs-l-6-8896149.pdf?src-supplier=Avnet; ComponentLink1Description: https://datasheet.ciiva.com/8896/pyu-rc0402-51-rohs-l-6-8896149.pdf?src-supplier=Avnet; ComponentLink2URL: https://datasheet.ciiva.com/16790/pyu-rc0402-51-rohs-l-6-r-16790444.pdf?src-supplier=Future+Electronics; ComponentLink2Description: https://datasheet.ciiva.com/16790/pyu-rc0402-51-rohs-l-6-r-16790444.pdf?src-supplier=Future+Electronics; Supplier Part Number 1: 603-RC0402FR-070RL; LCSC Part Number: C106231
R194 = RC0402FR-071K5L: RES 1.5K OHM 1% 1/16W 0402; Manufacturer: Yageo; Resistance: 1.5kR; Power Rating: 62.5mW; Voltage Rating: 50V; Temperature Coefficient: 100ppm/°C; Max Power Dissipation: 63mW; Supplier 1: Digi-Key; Manufacturer Part Number: RC0402FR-071K5L; RoHS: Yes; Category: Chip SMD Resistors; Stock 1: 2832947; Pricing 1: 1=0.10000, 10=0.01500, 100=0.00610, 1000=0.00275, 2500=0.00239, 5000=0.00197 (USD); Case/Package: 0402; Case Code (Metric): 1005; Case Code (Imperial): 0402; Size Code: 0402; Min Operating Temperature: -55°C; Max Operating Temperature: 155°C; Resistor Type: Thick Film; Package Quantity: 1; Tolerance: 1%; Packaging: Tape and Reel; Number of Terminations: 2; Termination: SMD/SMT; Features: Moisture Resistant; Series: RC; Resistance Tolerance: 1%; Construction: Rectangular; Technology: THICK FILM; Length: 1mm; Width: 0.02inch; Height: 0.016inch; Depth: 0.5mm; RoHS Compliant: Yes; REACH SVHC: No SVHC; Military Standard: Not; Lead Free: Lead Free; ComponentLink1URL: https://datasheet.ciiva.com/11808/0900766b80c66297-11808238.pdf?src-supplier=RSComponents; ComponentLink1Description: https://datasheet.ciiva.com/11808/0900766b80c66297-11808238.pdf?src-supplier=RSComponents; ComponentLink2URL: https://datasheet.ciiva.com/46394/1018594-46394950.pdf?src-supplier=Element14; ComponentLink2Description: https://datasheet.ciiva.com/46394/1018594-46394950.pdf?src-supplier=Element14; ComponentLink3URL: https://datasheet.ciiva.com/2453/pyu-r-int-thick-7-2453440.pdf?src-supplier=Digi-Key; ComponentLink3Description: https://datasheet.ciiva.com/2453/pyu-r-int-thick-7-2453440.pdf?src-supplier=Digi-Key; ComponentLink4URL: https://datasheet.ciiva.com/2453/pyu-r-int-thick-7-2453441.pdf?src-supplier=Digi-Key; ComponentLink4Description: https://datasheet.ciiva.com/2453/pyu-r-int-thick-7-2453441.pdf?src-supplier=Digi-Key; ComponentLink5URL: https://datasheet.ciiva.com/2453/pyu-r-int-thick-7-2453439.pdf?src-supplier=Digi-Key; ComponentLink5Description: https://datasheet.ciiva.com/2453/pyu-r-int-thick-7-2453439.pdf?src-supplier=Digi-Key; ComponentLink6URL: https://datasheet.ciiva.com/12558/pyu-rc0402-51-rohs-l-6-r-8721-12558542.pdf?src-supplier=Mouser; ComponentLink6Description: https://datasheet.ciiva.com/12558/pyu-rc0402-51-rohs-l-6-r-8721-12558542.pdf?src-supplier=Mouser; ComponentLink7URL: https://datasheet.ciiva.com/7849/1018594-7849863.pdf?src-supplier=Element14; ComponentLink7Description: https://datasheet.ciiva.com/7849/1018594-7849863.pdf?src-supplier=Element14; ComponentLink8URL: https://datasheet.ciiva.com/7849/1018594-7849864.pdf?src-supplier=Element14; ComponentLink8Description: https://datasheet.ciiva.com/7849/1018594-7849864.pdf?src-supplier=Element14; ComponentLink9URL: https://datasheet.ciiva.com/15189/getdatasheetpartid-323992-15189370.pdf?src-supplier=Verical; ComponentLink9Description: https://datasheet.ciiva.com/15189/getdatasheetpartid-323992-15189370.pdf?src-supplier=Verical; Supplier Part Number 1: 311-1.50KLRCT-ND; LCSC Part Number: C114759
U16 = RTL8363NB-VB-CG: QFN-76 Ethernet Transceivers ROHS; Manufacturer: Realtek Semicon; Item Type: IC; Manufacturer Part Number: RTL8363NB-VB-CG; Package: QFN-76; LCSC Part Number: C2835942; ComponentLink1Description: LCSC; ComponentLink1URL: https://www.lcsc.com/product-detail/Ethernet-Transceivers_Realtek-Semicon-RTL8363NB-VB-CG_C2835942.html
X2 = Q22FA12800090: CRYSTAL 25.0000MHZ 12PF SMD; Manufacturer: Seiko Epson; ComponentLink1Description: LCSC; ComponentLink1URL: https://www.lcsc.com/product-detail/Crystals_Seiko-Epson-Q22FA12800090_C255883.html; Manufacturer Part Number: Q22FA12800090; Package: SMD2016-4P; LCSC Part Number: C255883; Item Type: Crystal

## Sheet MIPI-CSI_RXX_INTERFACE.SchDoc
size A4; SheetNumber: 22; SheetTotal: 26
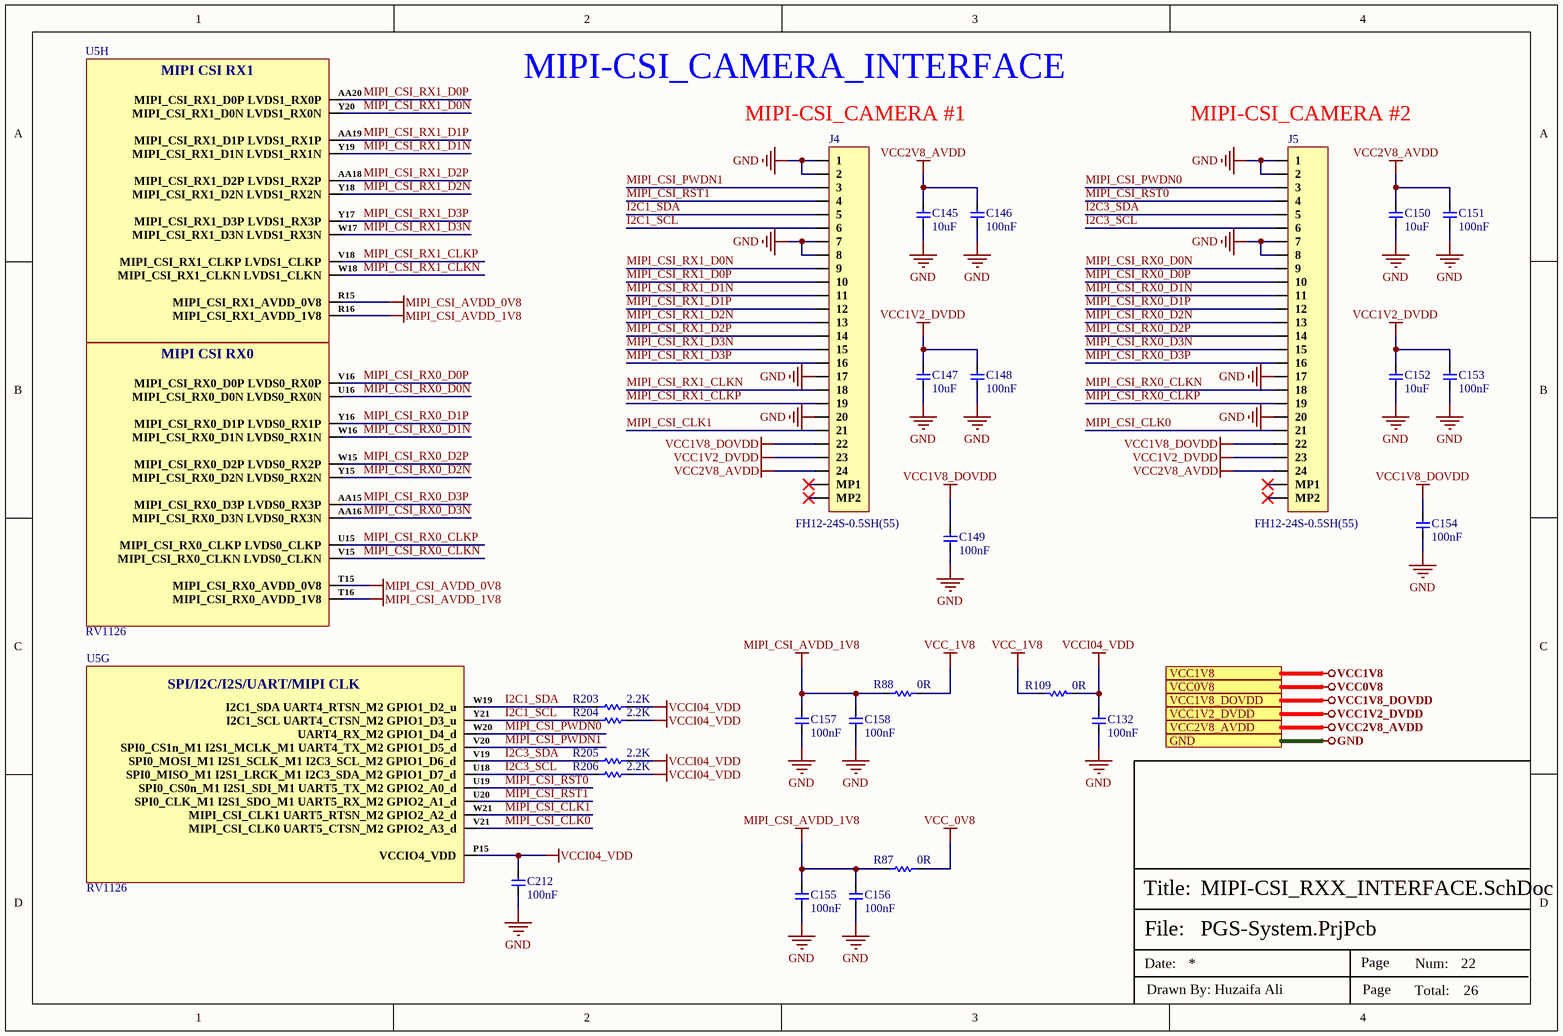
[diagram p21: MIPI-CSI_RXX_INTERFACE.SchDoc]

### Parts
C132  100nF  [CAP-0201]
C145  10uF  [Cap-0603]
C146  100nF  [CAP-0201]
C147  10uF  [Cap-0603]
C148  100nF  [CAP-0201]
C149  100nF  [CAP-0201]
C150  10uF  [Cap-0603]
C151  100nF  [CAP-0201]
C152  10uF  [Cap-0603]
C153  100nF  [CAP-0201]
C154  100nF  [CAP-0201]
C155  100nF  [CAP-0201]
C156  100nF  [CAP-0201]
C157  100nF  [CAP-0201]
C158  100nF  [CAP-0201]
C212  100nF  [CAP-0201]
J4  FH12-24S-0.5SH(55)  [FH12-24S-0.5SH(55)_]
J5  FH12-24S-0.5SH(55)  [FH12-24S-0.5SH(55)_]
R87  0R  [Res-0402]
R88  0R  [Res-0402]
R109  0R  [Res-0402]
R203  2.2K  [Res-0402]
R204  2.2K  [Res-0402]
R205  2.2K  [Res-0402]
R206  2.2K  [Res-0402]
U5  RV1126  [FCCSP-409(14x14)]  (parts G,H of 15)

### Ports
GND (see DDR3_SDRAM_INTERFACE[5D], DEBUG_UART_INTERFACE[3D], DIGITAL_MEMS_MIC_INTERFACE[3C], eMMC_INTERFACE[3D], ETHERNET_PoE-PD_INTERFACE[4D], ETHERNET_SWITCH_INTERFACE[5D], IR-CUT_LIGHT SENSOR_SHEET[3D], MIPI TO HDMI_MODULE_INTERFACE[3D], PoE_PSE_CONTROLLER[5D], POWER_LDO_SHEET[3D], POWER_PMIC_RK809_CODEC[3C], POWER_PMIC_RK809_DC DC[3D], POWER_PMIC_RK809_LDO[4C], POWER_PMIC_RK809_MANAGEMENT[3D], RV1126_AUDIO_SHEET[3D], RV1126_DRAM_SHEET[4C], RV1126_eMMC_SPI-FLASH[3C], RV1126_ETHERNET_SHEET[3D], RV1126_OSC-PLL-PMUIO[3C], RV1126_POWER_SHEET[1D], RV1126_SARADC_SHEET[3C], RV1126_SDMMC_SHEET[3C], SPI_FLASH_INTERFACE[3D], SYNCHRONOUS _BUCK_CONTROLLER[3D], USB2.0_DEBUG_UART[3D], WIFI_AP6256_SHEET[3C]), VCC0V8 (see MIPI TO HDMI_MODULE_INTERFACE[3D], POWER_PMIC_RK809_LDO[4C], USB2.0_DEBUG_UART[3D]), VCC1V2_DVDD (see POWER_PMIC_RK809_LDO[4C]), VCC1V8 (see DIGITAL_MEMS_MIC_INTERFACE[3C], IR-CUT_LIGHT SENSOR_SHEET[3D], MIPI TO HDMI_MODULE_INTERFACE[3D], POWER_PMIC_RK809_LDO[4C], POWER_PMIC_RK809_MANAGEMENT[3D], RV1126_AUDIO_SHEET[3D], RV1126_eMMC_SPI-FLASH[3C], RV1126_ETHERNET_SHEET[3D], RV1126_OSC-PLL-PMUIO[3C], RV1126_SARADC_SHEET[3C], RV1126_SDMMC_SHEET[3C], USB2.0_DEBUG_UART[3D], WIFI_AP6256_SHEET[3C]), VCC1V8_DOVDD (see POWER_PMIC_RK809_LDO[4C]), VCC2V8_AVDD (see POWER_PMIC_RK809_LDO[4C])

### Nets
GND: C132.1 C145.1 C146.1 C147.1 C148.1 C149.1 C150.1 C151.1 C152.1 C153.1 C154.1 C155.1 C156.1 C157.1 C158.1 C212.1 J4.1 J4.2 J4.7 J4.8 J4.17 J4.20 J5.1 J5.2 J5.7 J5.8 J5.17 J5.20 ; port GND  [project net KSENSD]
MIPI_CSI_AVDD_0V8: U5.R15(MIPI_CSI_RX1_AVDD_0V8) U5.T15(MIPI_CSI_RX0_AVDD_0V8)
MIPI_CSI_AVDD_1V8: C155.2 C156.2 C157.2 C158.2 R87.1 R88.1 U5.R16(MIPI_CSI_RX1_AVDD_1V8) U5.T16(MIPI_CSI_RX0_AVDD_1V8)
VCC1V2_DVDD: C147.2 C148.2 C152.2 C153.2 J4.23 J5.23 ; port VCC1V2_DVDD
VCC1V8_DOVDD: C149.2 C154.2 J4.22 J5.22 ; port VCC1V8_DOVDD
VCC2V8_AVDD: C145.2 C146.2 C150.2 C151.2 J4.24 J5.24 ; port VCC2V8_AVDD
VCC_0V8: R87.2
VCC_1V8: R88.2 R109.2
VCCI04_VDD: C132.2 C212.2 R109.1 R203.2 R204.2 R205.2 R206.2 U5.P15(VCCIO4_VDD)
I2C1_SCL: J4.6 R204.1 U5.Y21(I2C1_SCL_UART4_CTSN_M2_GPIO1_D3_u)
I2C1_SDA: J4.5 R203.1 U5.W19(I2C1_SDA_UART4_RTSN_M2_GPIO1_D2_u)
I2C3_SCL: J5.6 R206.1 U5.U18(SPI0_MISO_M1_I2S1_LRCK_M1_I2C3_SDA_M2_GPIO1_D7_d)
I2C3_SDA: J5.5 R205.1 U5.V19(SPI0_MOSI_M1_I2S1_SCLK_M1_I2C3_SCL_M2_GPIO1_D6_d)
MIPI_CSI_CLK0: J5.21 U5.V21(MIPI_CSI_CLK0_UART5_CTSN_M2_GPIO2_A3_d)
MIPI_CSI_CLK1: J4.21 U5.W21(MIPI_CSI_CLK1_UART5_RTSN_M2_GPIO2_A2_d)
MIPI_CSI_PWDN0: J5.3 U5.W20(UART4_RX_M2_GPIO1_D4_d)
MIPI_CSI_PWDN1: J4.3 U5.V20(SPI0_CS1n_M1_I2S1_MCLK_M1_UART4_TX_M2_GPIO1_D5_d)
MIPI_CSI_RST0: J5.4 U5.U19(SPI0_CS0n_M1_I2S1_SDI_M1_UART5_TX_M2_GPIO2_A0_d)
MIPI_CSI_RST1: J4.4 U5.U20(SPI0_CLK_M1_I2S1_SDO_M1_UART5_RX_M2_GPIO2_A1_d)
MIPI_CSI_RX0_CLKN: J5.18 U5.V15(MIPI_CSI_RX0_CLKN_LVDS0_CLKN)
MIPI_CSI_RX0_CLKP: J5.19 U5.U15(MIPI_CSI_RX0_CLKP_LVDS0_CLKP)
MIPI_CSI_RX0_D0N: J5.9 U5.U16(MIPI_CSI_RX0_D0N_LVDS0_RX0N)
MIPI_CSI_RX0_D0P: J5.10 U5.V16(MIPI_CSI_RX0_D0P_LVDS0_RX0P)
MIPI_CSI_RX0_D1N: J5.11 U5.W16(MIPI_CSI_RX0_D1N_LVDS0_RX1N)
MIPI_CSI_RX0_D1P: J5.12 U5.Y16(MIPI_CSI_RX0_D1P_LVDS0_RX1P)
MIPI_CSI_RX0_D2N: J5.13 U5.Y15(MIPI_CSI_RX0_D2N_LVDS0_RX2N)
MIPI_CSI_RX0_D2P: J5.14 U5.W15(MIPI_CSI_RX0_D2P_LVDS0_RX2P)
MIPI_CSI_RX0_D3~{N}: J5.15 U5.AA16(MIPI_CSI_RX0_D3N_LVDS0_RX3N)
MIPI_CSI_RX0_D3P: J5.16 U5.AA15(MIPI_CSI_RX0_D3P_LVDS0_RX3P)
MIPI_CSI_RX1_CLKN: J4.18 U5.W18(MIPI_CSI_RX1_CLKN_LVDS1_CLKN)
MIPI_CSI_RX1_CLKP: J4.19 U5.V18(MIPI_CSI_RX1_CLKP_LVDS1_CLKP)
MIPI_CSI_RX1_D0N: J4.9 U5.Y20(MIPI_CSI_RX1_D0N_LVDS1_RX0N)
MIPI_CSI_RX1_D0P: J4.10 U5.AA20(MIPI_CSI_RX1_D0P_LVDS1_RX0P)
MIPI_CSI_RX1_D1N: J4.11 U5.Y19(MIPI_CSI_RX1_D1N_LVDS1_RX1N)
MIPI_CSI_RX1_D1P: J4.12 U5.AA19(MIPI_CSI_RX1_D1P_LVDS1_RX1P)
MIPI_CSI_RX1_D2N: J4.13 U5.Y18(MIPI_CSI_RX1_D2N_LVDS1_RX2N)
MIPI_CSI_RX1_D2P: J4.14 U5.AA18(MIPI_CSI_RX1_D2P_LVDS1_RX2P)
MIPI_CSI_RX1_D3N: J4.15 U5.W17(MIPI_CSI_RX1_D3N_LVDS1_RX3N)
MIPI_CSI_RX1_D3P: J4.16 U5.Y17(MIPI_CSI_RX1_D3P_LVDS1_RX3P)

Not connected (* = marked no-connect by the designer): J4 MP1* MP2*; J5 MP1* MP2*

### Notes on the sheet
- MIPI-CSI_CAMERA_INTERFACE
- (near J4) MIPI-CSI_CAMERA #1
- (near J5) MIPI-CSI_CAMERA #2
- File:
- Title:
- Date:
- Page
- Num:
- Total:
- Drawn By: Huzaifa Ali
- (in symbol RV1126, part G) SPI/I2C/I2S/UART/MIPI CLK
- (in symbol RV1126, part H) MIPI CSI RX1; MIPI CSI RX0

### Library data of the parts
C132 C146 C148 C149 C151 C153-C158 C212 = CC0201KRX5R6BB104: as C46-C52 on sheet eMMC_INTERFACE; Supplier 1: Mouser; Manufacturer Part Number: CC0201KRX5R6BB104; RoHS: Yes; Category: Ceramic Capacitors; Stock 1: 824403; Pricing 1: 1=0.10000, 10=0.02400, 50=0.02400, 100=0.01900, 1000=0.01100, 10000=0.00900 (USD); Mount: Surface Mount; Case/Package: 0201; Case Code (Imperial): 0201; Case Code (Metric): 0603; Weight: 6E-06oz; Min Operating Temperature: -55°C; Max Operating Temperature: 85°C; Capacitance: 100nF; Dielectric: X5R; Voltage Rating (DC): 10V; Packaging: Tape and Reel; Termination: SMD/SMT; Resistor Type: Ceramic; Voltage Rating: 10V; Series: CC; Construction: Flat; Length: 0.6mm; Width: 0.012inch; Height: 0.3mm; Thickness: 0.013inch; Depth: 0.3mm; Radiation Hardening: No; Lead Free: Lead Free; Halogen Free: Halogen Free; RoHS Compliant: Yes; ComponentLink1URL: https://datasheet.ciiva.com/11587/upy-gphc-x5r-4v-to-50v-12-11587190.pdf?src-supplier=Avnet; ComponentLink1Description: https://datasheet.ciiva.com/11587/upy-gphc-x5r-4v-to-50v-12-11587190.pdf?src-supplier=Avnet; Supplier Part Number 1: 603-CC201KRX5R6BB104; LCSC Part Number: C190183
C145 C147 C150 C152 = CC0603KRX5R6BB106: as C56 on sheet DDR3_SDRAM_SHEET; Supplier 1: Digi-Key; Manufacturer Part Number: CC0603KRX5R6BB106; RoHS: Yes; Category: Ceramic Capacitors; Stock 1: 187515; Pricing 1: 1=0.24000, 10=0.16300, 50=0.09780, 100=0.08260, 500=0.05654, 1000=0.05001 (USD); Mount: Surface Mount; Case/Package: 0603; Case Code (Metric): 1608; Case Code (Imperial): 0603; Weight: 7.1E-05oz; Min Operating Temperature: -55°C; Max Operating Temperature: 85°C; Capacitance: 10uF; Packaging: Tape and Reel; Dielectric: X5R; Voltage Rating: 10V; Termination: SMD/SMT; Resistor Type: Ceramic; Voltage Rating (DC): 10V; Package Quantity: 4000; Length: 0.063inch; Width: 0.031inch; Thickness: 0.035inch; Depth: 0.8mm; Lead Free: Lead Free; Halogen Free: Halogen Free; RoHS Compliant: Yes; ComponentLink1URL: http://www.mouser.com/ds/2/447/Yageo_UPY-GP_NP0_16V-to-50V_9-358835.pdf?src-supplier=Mouser; ComponentLink1Description: http://www.mouser.com/ds/2/447/Yageo_UPY-GP_NP0_16V-to-50V_9-358835.pdf?src-supplier=Mouser; ComponentLink2URL: http://www.yageo.com/documents/recent/UPY-GPHC_X5R_4V-to-50V_25.pdf?src-supplier=Digi-Key; ComponentLink2Description: http://www.yageo.com/documents/recent/UPY-GPHC_X5R_4V-to-50V_25.pdf?src-supplier=Digi-Key; Supplier Part Number 1: 311-1782-1-ND; LCSC Part Number: C326057
J4 J5 = FH12-24S-0.5SH(55): CONN FFC BOTTOM 24POS 0.50MM R/A; Manufacturer: Hirose; Item Type: FFC Connector; Supplier 1: RSComponents; Manufacturer Part Number: FH12-24S-0.5SH(55); RoHS: Yes; Category: FFC / FPC; Stock 1: 30; Pricing 1: 5=0.91700, 100=0.76200, 375=0.63900, 1500=0.59600, 3000=0.55300 (USD); ComponentLink1URL: https://datasheet.ciiva.com/15176/getdatasheetpartid-439675-15176853.pdf?src-supplier=Verical; ComponentLink1Description: https://datasheet.ciiva.com/15176/getdatasheetpartid-439675-15176853.pdf?src-supplier=Verical; ComponentLink2URL: https://datasheet.ciiva.com/22630/58803-22630351.pdf?src-supplier=Farnell; ComponentLink2Description: https://datasheet.ciiva.com/22630/58803-22630351.pdf?src-supplier=Farnell; ComponentLink3URL: https://datasheet.ciiva.com/5137/ed-fh12-20140305-355586-5137161.pdf?src-supplier=Mouser; ComponentLink3Description: https://datasheet.ciiva.com/5137/ed-fh12-20140305-355586-5137161.pdf?src-supplier=Mouser; ComponentLink4URL: https://datasheet.ciiva.com/22697/58803-22697094.pdf?src-supplier=Element14; ComponentLink4Description: https://datasheet.ciiva.com/22697/58803-22697094.pdf?src-supplier=Element14; ComponentLink5URL: https://datasheet.ciiva.com/7661/58803-7661382.pdf?src-supplier=Element14; ComponentLink5Description: https://datasheet.ciiva.com/7661/58803-7661382.pdf?src-supplier=Element14; Supplier Part Number 1: 7388827; LCSC Part Number: C202112
R87 R88 = RCS04020000Z0ED: RES SMD 0 OHM JUMPER 1/5W 0402; Manufacturer: Vishay Dale; Resistance: 0mR; Max Power Dissipation: 200mW; Item Type: Resistor; Supplier 1: Digi-Key; Manufacturer Part Number: RCS04020000Z0ED; Stock 1: 35470; Pricing 1: 1=0.1, 10=0.083, 25=0.0576, 50=0.0448, 100=0.032, 250=0.02496, 500=0.01984, 1000=0.01408, 5000=0.01088 (USD); Case/Package: 0402; Case Code (Metric): 1005; Case Code (Imperial): 0402; Min Operating Temperature: -55°C; Max Operating Temperature: 155°C; Packaging: Tape and Reel; Resistor Type: Thick Film; Number of Terminations: 2; Features: Automotive AEC-Q200; Length: 0.039inch; Width: 0.02inch; Height: 0.016inch; RoHS Compliant: Yes; ComponentLink1URL: http://www.farnell.com/datasheets/2618474.pdf?src-supplier=Farnell; ComponentLink1Description: http://www.farnell.com/datasheets/2618474.pdf?src-supplier=Farnell; ComponentLink2URL: http://www.farnell.com/datasheets/2618474.pdf?src-supplier=Element14; ComponentLink2Description: http://www.farnell.com/datasheets/2618474.pdf?src-supplier=Element14; ComponentLink3URL: http://www.vishay.com/docs/20065/rcse3.pdf?src-supplier=Digi-Key; ComponentLink3Description: http://www.vishay.com/docs/20065/rcse3.pdf?src-supplier=Digi-Key; ComponentLink4URL: http://www.farnell.com/datasheets/2618474.pdf?src-supplier=Newark; ComponentLink4Description: http://www.farnell.com/datasheets/2618474.pdf?src-supplier=Newark; Supplier Part Number 1: 541-2877-1-ND; LCSC Part Number: C844673
R109 = RC0402FR-070RL: as R28 on sheet DDR3_SDRAM_SHEET; Supplier 1: Mouser; Manufacturer Part Number: RC0402FR-070RL; RoHS: Yes; Stock 1: 8556842; Pricing 1: 1=0.10000, 10=0.01400, 50=0.01400, 100=0.00600, 1000=0.00300, 5000=0.00200, 10000=0.00100 (USD); Mount: Surface Mount; Case/Package: 0402; Contact Plating: Tin,Matte; Case Code (Imperial): 0402; Case Code (Metric): 1005; Size Code: 0402; Min Operating Temperature: -55°C; Max Operating Temperature: 155°C; Resistance: 0R; Resistor Type: Thick Film; Packaging: Tape and Reel; Termination: SMD/SMT; Features: Moisture Resistant; Series: RC; Number of Terminations: 2; Length: 1mm; Width: 0.5mm; Height: 0.35mm; Radiation Hardening: No; Lead Free: Lead Free; RoHS Compliant: Yes; ComponentLink1URL: https://datasheet.ciiva.com/8896/pyu-rc0402-51-rohs-l-6-8896149.pdf?src-supplier=Avnet; ComponentLink1Description: https://datasheet.ciiva.com/8896/pyu-rc0402-51-rohs-l-6-8896149.pdf?src-supplier=Avnet; ComponentLink2URL: https://datasheet.ciiva.com/16790/pyu-rc0402-51-rohs-l-6-r-16790444.pdf?src-supplier=Future+Electronics; ComponentLink2Description: https://datasheet.ciiva.com/16790/pyu-rc0402-51-rohs-l-6-r-16790444.pdf?src-supplier=Future+Electronics; Supplier Part Number 1: 603-RC0402FR-070RL; LCSC Part Number: C106231
R203-R206 = RC0402FR-072K2L: RES SMD 2.2K OHM 1% 1/16W 0402; Manufacturer: Yageo; Resistance: 2.2kR; Power Rating: 63mW; Voltage Rating: 50V; Temperature Coefficient: 100ppm/°C; Supplier 1: Digi-Key; Manufacturer Part Number: RC0402FR-072K2L; Stock 1: 966157; Pricing 1: 1=0.1, 10=0.016, 100=0.0066, 1000=0.00299, 2500=0.00259, 5000=0.00214 (USD); Case/Package: 0402; Case Code (Imperial): 0402; Case Code (Metric): 1005; Weight: 2.3E-05oz; Size Code: 0402; Min Operating Temperature: -55°C; Max Operating Temperature: 155°C; Resistor Type: Thick Film; Packaging: Tape and Reel; Tolerance: 1%; Termination: SMD/SMT; Features: Moisture Resistant; Series: RC; Max Power Dissipation: 63mW; Number of Terminations: 2; Resistance Tolerance: 1%; Construction: Rectangular; Technology: THICK FILM; Length: 1mm; Width: 0.5mm; Height: 0.35mm; Depth: 0.5mm; RoHS Compliant: Yes; REACH SVHC: Unknown; Military Standard: Not; Lead Free: Lead Free; ComponentLink1URL: http://www.farnell.com/datasheets/2167052.pdf?src-supplier=Element14; ComponentLink1Description: http://www.farnell.com/datasheets/2167052.pdf?src-supplier=Element14; ComponentLink2URL: http://www.yageo.com/documents/recent/PYu-RC_Group_51_RoHS_L_9.pdf?src-supplier=Mouser; ComponentLink2Description: http://www.yageo.com/documents/recent/PYu-RC_Group_51_RoHS_L_9.pdf?src-supplier=Mouser; ComponentLink3URL: http://documents.rs-components.com/techlib://itc_doclist_GB.htm?stockno=6186532&src-supplier=RSComponents; ComponentLink3Description: http://documents.rs-components.com/techlib://itc_doclist_GB.htm?stockno=6186532&src-supplier=RSComponents; ComponentLink4URL: http://www.yageo.com/documents/recent/PYu-RC0402_51_RoHS_L_6_r.pdf?src-supplier=Future+Electronics; ComponentLink4Description: http://www.yageo.com/documents/recent/PYu-RC0402_51_RoHS_L_6_r.pdf?src-supplier=Future+Electronics; Supplier Part Number 1: 311-2.20KLRCT-ND; LCSC Part Number: C114762
U5 = RV1126: FCCSP-409(14x14) Microcontroller Units (MCUs/MPUs/SOCs) ROHS; Manufacturer: Rockchip; Manufacturer Part Number: RV1126; Package: FCCSP-409(14x14); LCSC Part Number: C2859017; Item Type: Microcontroller; ComponentLink1Description: LCSC; ComponentLink1URL: https://www.lcsc.com/product-detail/Microcontroller-Units-MCUs-MPUs-SOCs_Rockchip-RV1126_C2859017.html